# Altium project USB_to_RS485.PrjPcb
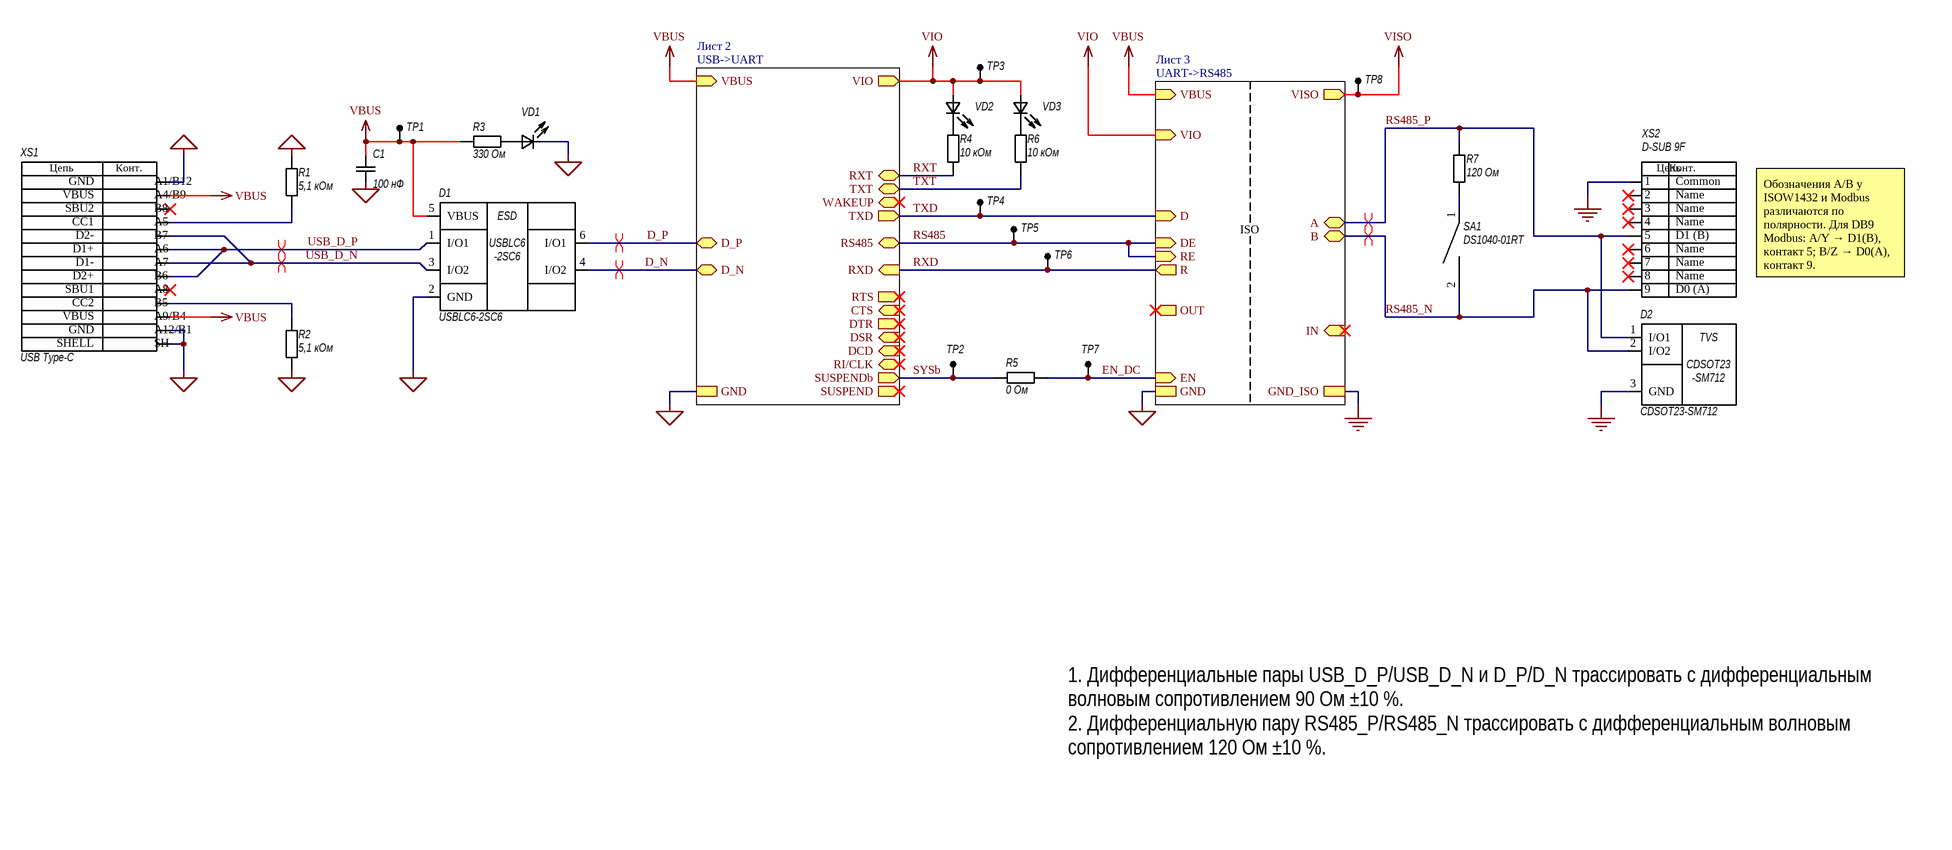
[diagram p0: MAIN.SchDoc]
п_Утв_Р: Лыткин; п_Разраб_Р: Иванов; п_Пров_Р: Смирнов; п_Н_контр_Р: Попов; Раздел: Документация; ПервПримен: XXXX.426477.001; Перв.Примен.: XXXX.426477.001; Обозначение_Код: XXXX.426477.001 Э3; Обозначение_PCB: XXXX.758765.001; Обозначение: XXXX.426477.001; Наименование_PCB: Плата печатная; Наименование1: Преобразователь USB–RS485; Наименование: Преобразователь USB–RS485; Код_документа_SCH: Э3; Вид_документа_SCH: Схема электрическая принципиальная; sheet_out_name: Преобразователь USB–RS485 XXXX.426477.001 Э3; GOSTBOM_AllowNoPCB: 0; draft_pcb_out: Плата печатная XXXX.758765.001; draft_ad_out: Преобразователь USB–RS485 XXXX.426477.001 СБ
3 sheets, 46 parts. Net scope: strictly hierarchical (ports join the sheet entries above them; power ports are local).
Board file: PCB.PcbDoc
Sheets:
  MAIN.SchDoc
    U_USBtoUART = USBtoUART.SchDoc
    U_USB_to_UART = UARTtoRS485.SchDoc

## Sheet MAIN.SchDoc
size 420 x 297 mm; SheetNumber: 1; SheetTotal: 3; SPICEModelCacheFXBRRBJG: <root> / <DocumentId>FXBRRBJG</DocumentId> / <CacheFrame Number="0"> / <Model Name="my_lib_c_rc" Kind="CKT"> / <Text>* MY_LIB YAGEO CC X7R: nominal capacitance, DFmax-derived Rs, minimum insulation. / * Source: YAGEO CC X7R March 6 2026 V.27 pp14-15,20. / * Rs=DFmax/(2*pi*1000*Cnom); Rins=min(1e10,K/Cnom). / * Constant Rs is justified at 1kHz only. Leakage adds a small extra AC loss. / * No tolerance, temperature, DC bias, ESL, aging, absorption or breakdown. / .SUBCKT MY_LIB_C_RC 1 2 PARAMS: Cvalue=1n Rsvalue=1 Rinsvalue=1e10 / Rloss 1 3 {Rsvalue} / Cmain 3 2 {Cvalue} / Rleak 1 2 {Rinsvalue} / .ENDS MY_LIB_C_RC</Text> / </Model> / </CacheFrame> / </root>

### Parts
C1  100 нФ  [CAPC2012X135N]
D1  USBLC6-2SC6  [ST_SOT23-6L]
D2  CDSOT23-SM712  [BOURNS_CDSOT23_SM712]
R1  5,1 кОм  [RESC2012X70N]
R2  5,1 кОм  [RESC2012X70N]
R3  330 Ом  [RESC2012X70N]
R4  10 кОм  [RESC2012X70N]
R5  0 Ом  [RESC2012X70N]
R6  10 кОм  [RESC2012X70N]
R7  120 Ом  [RESC2012X70N]
SA1  DS1040-01RT  [CONNFLY_DS1040_01RT]
TP1  D1.5mm  [TestPoint_Pad_D1.5mm]  (value not drawn)  (no BOM)
TP2  D1.5mm  [TestPoint_Pad_D1.5mm]  (value not drawn)  (no BOM)
TP3  D1.5mm  [TestPoint_Pad_D1.5mm]  (value not drawn)  (no BOM)
TP4  D1.5mm  [TestPoint_Pad_D1.5mm]  (value not drawn)  (no BOM)
TP5  D1.5mm  [TestPoint_Pad_D1.5mm]  (value not drawn)  (no BOM)
TP6  D1.5mm  [TestPoint_Pad_D1.5mm]  (value not drawn)  (no BOM)
TP7  D1.5mm  [TestPoint_Pad_D1.5mm]  (value not drawn)  (no BOM)
TP8  D1.5mm  [TestPoint_Pad_D1.5mm]  (value not drawn)  (no BOM)
VD1  TO-2013BC-PG  [LED_OA2013_080_090_1C2A]  (value not drawn)
VD2  TO-2013BC-PG  [LED_OA2013_080_090_1C2A]  (value not drawn)
VD3  TO-2013BC-PG  [LED_OA2013_080_090_1C2A]  (value not drawn)
XS1  USB Type-C  PinA1_B12_Name: GND  PinA4_B9_Name: VBUS  PinB8_Name: SBU2  PinA5_Name: CC1  PinB7_Name: D2-  PinA6_Name: D1+  PinA7_Name: D1-  PinB6_Name: D2+  PinA8_Name: SBU1  PinB5_Name: CC2  PinSH_Name: SHELL  [USB4110-GF-A_GCT]
XS2  D-SUB 9F  Pin9_Name: D0 (A)  Pin8_Name: Name  Pin5_Name: D1 (B)  Pin1_Name: Common  [CONNFLY_DS1037_01_09F]

### Sub-sheets
U_USB_to_UART = UARTtoRS485.SchDoc: VBUS (in), GND, OUT (out), EN (in), IN (in), VISO (out), GND_ISO, A (bidir), B (bidir), D (in), DE (in), RE (in), R (out), VIO (in)  | Page: Лист 3; Name: UART->RS485
U_USBtoUART = USBtoUART.SchDoc: RXT (bidir), TXT (bidir), WAKEUP (bidir), RS485 (bidir), TXD (out), RXD (in), VBUS (in), GND, VIO (out), SUSPENDb (out), SUSPEND (out), RTS (out), CTS (in), DTR (out), DSR (in), DCD (in), RI/CLK (bidir), D_N (bidir), D_P (bidir)  | Page: Лист 2; Name: USB->UART

### Nets
GND: C1.1 D1.2(GND) R1.2 R2.1 VD1.1(C) XS1.A1/B12(GND) XS1.A12/B1(GND) XS1.SH(SHELL) ; sheet U_USBtoUART/GND, sheet U_USB_to_UART/GND
GND_ISO: D2.3(GND) XS2.1(Name) ; sheet U_USB_to_UART/GND_ISO
VBUS: C1.2 D1.5(VBUS) R3.1 TP1.1(TP) XS1.A4/B9(VBUS) XS1.A9/B4(VBUS) ; sheet U_USBtoUART/VBUS, sheet U_USB_to_UART/VBUS
VIO: TP3.1(TP) VD2.2(A) VD3.2(A) ; sheet U_USBtoUART/VIO, sheet U_USB_to_UART/VIO
VISO: TP8.1(TP) ; sheet U_USB_to_UART/VISO
D_N: D1.4(I/O2) ; sheet U_USBtoUART/D_N
D_P: D1.6(I/O1) ; sheet U_USBtoUART/D_P
EN_DC: R5.2 TP7.1(TP) ; sheet U_USB_to_UART/EN
RS485: TP5.1(TP) ; sheet U_USBtoUART/RS485, sheet U_USB_to_UART/DE, sheet U_USB_to_UART/RE
RS485_N: D2.2(I/O2) SA1.2 XS2.9(Name) ; sheet U_USB_to_UART/B
RS485_P: D2.1(I/O1) R7.2 XS2.5(Name) ; sheet U_USB_to_UART/A
RXD: TP6.1(TP) ; sheet U_USBtoUART/RXD, sheet U_USB_to_UART/R
RXT: R4.1 ; sheet U_USBtoUART/RXT
SYSb: R5.1 TP2.1(TP) ; sheet U_USBtoUART/SUSPENDb
TXD: TP4.1(TP) ; sheet U_USBtoUART/TXD, sheet U_USB_to_UART/D
TXT: R6.1 ; sheet U_USBtoUART/TXT
USB_D_N: D1.3(I/O2) XS1.A7(D-1) XS1.B7(D-2)
USB_D_P: D1.1(I/O1) XS1.A6(D+1) XS1.B6(D+2)
NetR1_1: R1.1 XS1.A5(CC1)
NetR2_2: R2.2 XS1.B5(CC2)
NetR3_2: R3.2 VD1.2(A)
NetR4_2: R4.2 VD2.1(C)
NetR6_2: R6.2 VD3.1(C)
NetR7_1: R7.1 SA1.1

Not connected (* = marked no-connect by the designer): XS1 A8(SBU1)* B8(SBU2)*; XS2 2(Name)* 3(Name)* 4(Name)* 6(Name)* 7(Name)* 8(Name)*

### Layout directives
differential pair: D_N, D_P, RS485_N, RS485_P, USB_D_N, USB_D_P

### Notes on the sheet
- ISO
- Обозначения A/B у ISOW1432 и Modbus различаются по полярности. Для DB9 Modbus: A/Y → D1(B), контакт 5; B/Z → D0(A), контакт 9.
- 1. Дифференциальные пары USB_D_P/USB_D_N и D_P/D_N трассировать с дифференциальным волновым сопротивлением 90 Ом ±10 %.
  2. Дифференциальную пару RS485_P/RS485_N трассировать с дифференциальным волновым сопротивлением 120 Ом ±10 %.
- Перв. примен.
- Справ. №
- Подп. дата
- Инв. № дубл.
- Взам. инв. №
- Подп. и дата
- Изм.
- Разраб.
- Лист
- № докум.
- Подп.
- Дата
- Лит.
- Масса
- Масштаб
- Пров.
- Т.контр.
- Листов
- Инв. № подл.
- Н.контр.
- Утв.
- ALTIUM GOSTBOM2.0 KEV
- Копировал
- Формат А3
- (in symbol U0003) ESD; USBLC6; -2SC6
- (in symbol U0005) TVS; CDSOT23; -SM712
- (in symbol XS0001) Цепь; Конт.
- (in symbol XS0002) Конт.; Цепь

### Library data of the parts
C1 = C0132: Конденсатор 100 нФ ±20% 100 В X7R 0805; Manufacturer: YAGEO; MPN: CC0805MKX7R0BB104; ID: C0132; Value: 100n; Voltage: 100 В; Notes: YAGEO CC; список 20.10.2026; CapacitanceNominalF: 1E-7; DissipationFactorMax: 0.025; DFTestFrequencyHz: 1000; DFTestVoltageVrms: 1; DFTestTemperatureC: 20; InsulationTimeConstantMinS: 500; InsulationResistanceMinOhm: 5000000000; InsulationTestVoltageV: 100; InsulationTestDurationS: 60; EquivalentSeriesResistanceOhm: 39.7887357729738; Type: Конденсатор; ESKD_value: 100 нФ; Tolerance: ±20%; Package: 0805; CommentBase: Конденсатор 100 нФ ±20% 100 В X7R 0805; Dielectric: X7R; ComponentLink2URL: https://yageogroup.com/content/datasheet/asset/file/UPY-GPHC_X7R_6_3V-TO-250V; ComponentLink2Description: Даташит — производитель; HelpURL: C:\Users\Nomatin\Documents\Altium\MY_LIB\MY_LIB\Datasheets\YAGEO_CC_X7R.pdf; ComponentLink1URL: C:\Users\Nomatin\Documents\Altium\MY_LIB\MY_LIB\Datasheets\YAGEO_CC_X7R.pdf; ComponentLink1Description: Даташит — локальный; Datasheet: C:\Users\Nomatin\Documents\Altium\MY_LIB\MY_LIB\Datasheets\YAGEO_CC_X7R.pdf
D1 = U0003: Микросхема USBLC6-2SC6; Manufacturer: STMicroelectronics; ID: U0003; Voltage: 5.25 V (VRM); Notes: ESD-защита двух линий USB. Tj −40…+150 °C (не TA), табл. 1 absolute ratings. I/O1=1,6; I/O2=3,4; GND=2; VBUS=5.; TemperatureReference: Tj (junction), °C; Table 1 absolute ratings; JunctionTemperatureMin: -40; JunctionTemperatureMax: 150; Type: Микросхема; Value: USBLC6-2SC6; ESKD_value: USBLC6-2SC6; Package: SOT23-6L; MPN: USBLC6-2SC6; CommentBase: Микросхема USBLC6-2SC6; OperatingTemperatureMin: -40; OperatingTemperatureMax: 150; StorageTemperatureMin: -55; StorageTemperatureMax: 150; Datasheet: C:\Users\Nomatin\Documents\Altium\MY_LIB\MY_LIB\Datasheets\USBLC6-2_ST.pdf; DatasheetRevision: DS4260 Rev 7, December 2021; ComponentLink1Description: Даташит — локальный; ComponentLink1URL: C:\Users\Nomatin\Documents\Altium\MY_LIB\MY_LIB\Datasheets\USBLC6-2_ST.pdf; ComponentLink2URL: https://www.st.com/resource/en/datasheet/usblc6-2.pdf; ComponentLink2Description: Даташит — производитель; HelpURL: C:\Users\Nomatin\Documents\Altium\MY_LIB\MY_LIB\Datasheets\USBLC6-2_ST.pdf
D2 = U0005: TVS-сборка CDSOT23-SM712; Manufacturer: Bourns; ID: U0005; Power: 400 Вт (импульс 8/20 мкс); Voltage: VWM: 7/12 В (по полярности); Notes: RS-485 TVS: 1=I/O1, 2=I/O2, 3=GND. VWM: 3→1/2 — 7 В; 1/2→3 — 12 В. IPP 17 А, 8/20 мкс.; TemperatureReference: TOPR, °C; datasheet absolute ratings; Type: TVS-сборка; Value: CDSOT23-SM712; ESKD_value: CDSOT23-SM712; Package: SOT23-3; MPN: CDSOT23-SM712; CommentBase: TVS-сборка CDSOT23-SM712; OperatingTemperatureMin: -55; OperatingTemperatureMax: 150; StorageTemperatureMin: -55; StorageTemperatureMax: 150; Datasheet: C:\Users\Nomatin\Documents\Altium\MY_LIB\MY_LIB\Datasheets\CDSOT23-SM712_Bourns.pdf; DatasheetRevision: Rev. 06/24; ComponentLink1Description: Даташит — локальный; ComponentLink1URL: C:\Users\Nomatin\Documents\Altium\MY_LIB\MY_LIB\Datasheets\CDSOT23-SM712_Bourns.pdf; ComponentLink2Description: Даташит — производитель; ComponentLink2URL: https://www.bourns.com/docs/product-datasheets/cdsot23-sm712.pdf; HelpURL: C:\Users\Nomatin\Documents\Altium\MY_LIB\MY_LIB\Datasheets\CDSOT23-SM712_Bourns.pdf
R1 R2 = R0243: Резистор 5,1 кОм ±5% 0805; Manufacturer: YAGEO; MPN: RC0805JR-075K1L; ID: R0243; Value: 5.1k; Power: 0,125 Вт; Voltage: 150 В макс.; Notes: RC_L; E24; P при 70 °C; SPICE: +100 ppm/°C при 25 °C — положительная граница ±100, не измеренный ТКС (RC_L, табл.2/5, стр.5/8).; TCR: ±100 ppm/°C; Type: Резистор; ESKD_value: 5,1 кОм; Tolerance: ±5%; Package: 0805; CommentBase: Резистор 5,1 кОм ±5% 0805; ComponentLink2URL: https://yageogroup.com/content/datasheet/asset/file/PYU-RC_GROUP_51_ROHS_L; ComponentLink2Description: Даташит — производитель; HelpURL: C:\Users\Nomatin\Documents\Altium\MY_LIB\MY_LIB\Datasheets\YAGEO_RC_L.pdf; ComponentLink1URL: C:\Users\Nomatin\Documents\Altium\MY_LIB\MY_LIB\Datasheets\YAGEO_RC_L.pdf; ComponentLink1Description: Даташит — локальный; Datasheet: C:\Users\Nomatin\Documents\Altium\MY_LIB\MY_LIB\Datasheets\YAGEO_RC_L.pdf
R3 = R0214: Резистор 330 Ом ±5% 0805; Manufacturer: YAGEO; MPN: RC0805JR-07330RL; ID: R0214; Value: 330R; Power: 0,125 Вт; Voltage: 150 В макс.; Notes: RC_L; E24; P при 70 °C; SPICE: +100 ppm/°C при 25 °C — положительная граница ±100, не измеренный ТКС (RC_L, табл.2/5, стр.5/8).; TCR: ±100 ppm/°C; Type: Резистор; ESKD_value: 330 Ом; Tolerance: ±5%; Package: 0805; CommentBase: Резистор 330 Ом ±5% 0805; Datasheet: C:\Users\Nomatin\Documents\Altium\MY_LIB\MY_LIB\Datasheets\YAGEO_RC_L.pdf; ComponentLink1Description: Даташит — локальный; ComponentLink1URL: C:\Users\Nomatin\Documents\Altium\MY_LIB\MY_LIB\Datasheets\YAGEO_RC_L.pdf; ComponentLink2Description: Даташит — производитель; ComponentLink2URL: https://yageogroup.com/content/datasheet/asset/file/PYU-RC_GROUP_51_ROHS_L; HelpURL: C:\Users\Nomatin\Documents\Altium\MY_LIB\MY_LIB\Datasheets\YAGEO_RC_L.pdf
R4 R6 = R0250: Резистор 10 кОм ±5% 0805; Manufacturer: YAGEO; MPN: RC0805JR-0710KL; ID: R0250; Value: 10k; Power: 0,125 Вт; Voltage: 150 В макс.; Notes: RC_L; E24; P при 70 °C; SPICE: +100 ppm/°C при 25 °C — положительная граница ±100, не измеренный ТКС (RC_L, табл.2/5, стр.5/8).; TCR: ±100 ppm/°C; Type: Резистор; ESKD_value: 10 кОм; Tolerance: ±5%; Package: 0805; CommentBase: Резистор 10 кОм ±5% 0805; ComponentLink2URL: https://yageogroup.com/content/datasheet/asset/file/PYU-RC_GROUP_51_ROHS_L; ComponentLink2Description: Даташит — производитель; HelpURL: C:\Users\Nomatin\Documents\Altium\MY_LIB\MY_LIB\Datasheets\YAGEO_RC_L.pdf; ComponentLink1URL: C:\Users\Nomatin\Documents\Altium\MY_LIB\MY_LIB\Datasheets\YAGEO_RC_L.pdf; ComponentLink1Description: Даташит — локальный; Datasheet: C:\Users\Nomatin\Documents\Altium\MY_LIB\MY_LIB\Datasheets\YAGEO_RC_L.pdf
R5 = R0005: Резистор 0 Ом 0805; Manufacturer: YAGEO; MPN: RC0805JR-070RL; ID: R0005; Value: 0R; Power: 0,125 Вт; Notes: Перемычка RC_L; R < 50 мОм; номинальный ток 2 А; J — код заказа перемычки, процентный допуск не применяется. Источник: https://www.yageogroup.com/content/datasheet/asset/file/PYU-RC_GROUP_51_ROHS_L; SPICE: ТКС перемычек не указан в RC_L; R=0,05 Ом сохранено, температурная зависимость не моделируется.; TCR: Не указан; Type: Резистор; ESKD_value: 0 Ом; Package: 0805; CommentBase: Резистор 0 Ом 0805; ComponentLink2URL: https://yageogroup.com/content/datasheet/asset/file/PYU-RC_GROUP_51_ROHS_L; ComponentLink2Description: Даташит — производитель; HelpURL: C:\Users\Nomatin\Documents\Altium\MY_LIB\MY_LIB\Datasheets\YAGEO_RC_L.pdf; ComponentLink1URL: C:\Users\Nomatin\Documents\Altium\MY_LIB\MY_LIB\Datasheets\YAGEO_RC_L.pdf; ComponentLink1Description: Даташит — локальный; Datasheet: C:\Users\Nomatin\Documents\Altium\MY_LIB\MY_LIB\Datasheets\YAGEO_RC_L.pdf
R7 = R0204: Резистор 120 Ом ±5% 0805; Manufacturer: YAGEO; MPN: RC0805JR-07120RL; ID: R0204; Value: 120R; Power: 0,125 Вт; Voltage: 150 В макс.; Notes: RC_L; E24; P при 70 °C; SPICE: +100 ppm/°C при 25 °C — положительная граница ±100, не измеренный ТКС (RC_L, табл.2/5, стр.5/8).; TCR: ±100 ppm/°C; Type: Резистор; ESKD_value: 120 Ом; Tolerance: ±5%; Package: 0805; CommentBase: Резистор 120 Ом ±5% 0805; ComponentLink2URL: https://yageogroup.com/content/datasheet/asset/file/PYU-RC_GROUP_51_ROHS_L; ComponentLink2Description: Даташит — производитель; HelpURL: C:\Users\Nomatin\Documents\Altium\MY_LIB\MY_LIB\Datasheets\YAGEO_RC_L.pdf; ComponentLink1URL: C:\Users\Nomatin\Documents\Altium\MY_LIB\MY_LIB\Datasheets\YAGEO_RC_L.pdf; ComponentLink1Description: Даташит — локальный; Datasheet: C:\Users\Nomatin\Documents\Altium\MY_LIB\MY_LIB\Datasheets\YAGEO_RC_L.pdf
SA1 = SA0001: Переключатель DS1040-01RT; Manufacturer: CONNFLY; ID: SA0001; Voltage: 24 В AC/DC; Notes: 1 позиция SPST Piano; красный корпус. 3D-модель приблизительная: см. REVIEW.md в папке footprint.; CurrentRating: 100 мА; TemperatureReference: Temperature Range, °C; DS1040 sheet 3; ContactForm: SPST; Positions: 1; MPN: DS1040-01RT; Datasheet: C:\Users\Nomatin\Documents\Altium\MY_LIB\MY_LIB\Datasheets\CONNFLY_DS1040_series.pdf; Type: Переключатель; Value: DS1040-01RT; ESKD_value: DS1040-01RT; Package: Piano DIP, THT, 2 вывода; CommentBase: Переключатель DS1040-01RT; DatasheetRevision: C-DS1040-01XT-E, Rev. E, 05.07.2019; ComponentLink1Description: Даташит — локальный; ComponentLink1URL: C:\Users\Nomatin\Documents\Altium\MY_LIB\MY_LIB\Datasheets\CONNFLY_DS1040_series.pdf; OperatingTemperatureMin: -40; OperatingTemperatureMax: 105; ComponentLink2URL: https://www.connfly.com/static/upload/file/pdf/DS1040.pdf; ComponentLink2Description: Даташит — производитель; HelpURL: C:\Users\Nomatin\Documents\Altium\MY_LIB\MY_LIB\Datasheets\CONNFLY_DS1040_series.pdf
TP1-TP8 = TP0002: Контрольная точка Площадка Ø1,5 мм; ID: TP0002; Notes: Одна круглая площадка Top Layer; маска открыта +0,05 мм; без отверстия, пасты и шелкографии. Standard (No BOM).; DiameterMm: 1.5; Standard: GOST 2.721-74, Table 6a, item 7; Type: Контрольная точка; Value: D1.5mm; ESKD_value: D1.5mm; Package: Площадка Ø1,5 мм; CommentBase: Контрольная точка Площадка Ø1,5 мм; ComponentType: Standard (No BOM)
VD1-VD3 = HL0009: Светодиод Чистый зелёный 3,2В 705мкд 0805; Manufacturer: Oasistek; ID: HL0009; Voltage: 3,2 В (тип., IF=20 мА); Notes: VF/IV: каталог 2021, IF=20 мА. Площадки по даташиту: 0,80×1,20; зазор 0,90 мм. 1=K, 2=A. Типовая 3D, не точный CAD Oasistek.; WavelengthNm: 525; ForwardVoltageTypicalV: 3.2; ForwardVoltageMaxV: 3.6; TestCurrentMa: 20; ViewingAngleDeg: 120; IntensityMinMcd: 321; IntensityTypicalMcd: 705; PinMapping: 1=C (K), 2=A; ChipMaterial: InGaN; LED_IS: 8.21368101376E-51; LED_N: 1; LED_RS: 13.4860774673; Type: Светодиод; Value: TO-2013BC-PG; ESKD_value: TO-2013BC-PG; Package: 0805; MPN: TO-2013BC-PG; CommentBase: Светодиод Чистый зелёный 3,2В 705мкд 0805; Datasheet: C:\Users\Nomatin\Documents\Altium\MY_LIB\MY_LIB\Datasheets\Oasistek_LED\TO-2013BC-PG.pdf; DatasheetRevision: Параметры: каталог 2021, стр.19–20; пины: Rev. A-1; 2017-06-09; GS1706012; ComponentLink1Description: Даташит — локальный; ComponentLink1URL: C:\Users\Nomatin\Documents\Altium\MY_LIB\MY_LIB\Datasheets\Oasistek_LED\TO-2013BC-PG.pdf; Color: Чистый зелёный; Family: TO-2013BC; ComponentLink2Description: Даташит — производитель; ComponentLink2URL: https://www.oasistek.com/upload/2021_SMD_Lamp_Catalogue.pdf; HelpURL: C:\Users\Nomatin\Documents\Altium\MY_LIB\MY_LIB\Datasheets\Oasistek_LED\TO-2013BC-PG.pdf
XS1 = XS0001: Разъём USB Type-C USB4110-GF-A; Manufacturer: GCT; ID: XS0001; Notes: USB 2.0; 12 сигнальных выводов + SH; 4 площадки корпуса SH; Value: USB Type-C; MPN: USB4110-GF-A; Datasheet: C:\Users\Nomatin\Documents\Altium\MY_LIB\MY_LIB\Datasheets\GCT_USB4110\USB4110_drawing.pdf; PinA9_B4_Name: VBUS; PinA12_B1_Name: GND; Type: Разъём; ESKD_value: USB Type-C; Package: USB Type-C, SMT; CommentBase: Разъём USB Type-C USB4110-GF-A; DatasheetRevision: B4, 22.05.2024; ComponentLink1Description: Даташит — локальный; ComponentLink1URL: C:\Users\Nomatin\Documents\Altium\MY_LIB\MY_LIB\Datasheets\GCT_USB4110\USB4110_drawing.pdf; ComponentLink2URL: https://gct.co/files/drawings/usb4110.pdf; ComponentLink2Description: Даташит — производитель; HelpURL: C:\Users\Nomatin\Documents\Altium\MY_LIB\MY_LIB\Datasheets\GCT_USB4110\USB4110_drawing.pdf
XS2 = XS0002: Разъём D-SUB 9F DS1037-01-09F; Manufacturer: CONNFLY; ID: XS0002; Notes: Контакты 1–9. Два крепления NPTH без электрического подключения. STEP пользователя встроен. См. REVIEW.md.; Value: D-SUB 9F; Pin7_Name: Name; Pin6_Name: Name; Pin4_Name: Name; Pin3_Name: Name; Pin2_Name: Name; Type: Разъём; ESKD_value: D-SUB 9F; Package: D-SUB-9, угловая розетка, THT; MPN: DS1037-01-09F; CommentBase: Разъём D-SUB 9F DS1037-01-09F; Datasheet: C:\Users\Nomatin\Documents\Altium\MY_LIB\MY_LIB\Datasheets\CONNFLY_DS1037-01.pdf; DatasheetRevision: C, 08.08.2017; ComponentLink1Description: Даташит — локальный; ComponentLink1URL: C:\Users\Nomatin\Documents\Altium\MY_LIB\MY_LIB\Datasheets\CONNFLY_DS1037-01.pdf; ComponentLink2URL: https://www.connfly.com/static/upload/file/pdf/DS1037-01.pdf; ComponentLink2Description: Даташит — производитель; HelpURL: C:\Users\Nomatin\Documents\Altium\MY_LIB\MY_LIB\Datasheets\CONNFLY_DS1037-01.pdf

## Sheet USBtoUART.SchDoc
size 209 x 297 mm; SheetNumber: 2; SheetTotal: 3
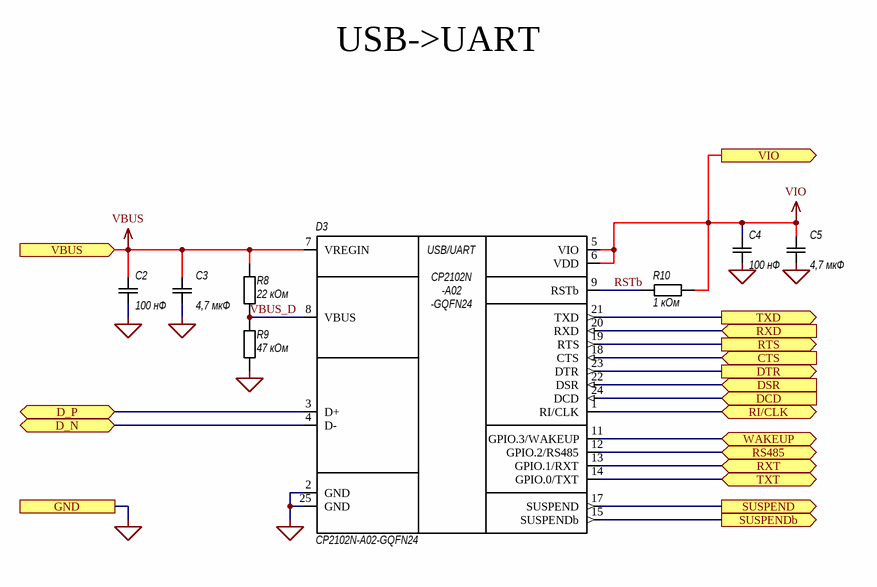
[diagram p1: USBtoUART.SchDoc]

### Parts
C2  100 нФ  [CAPC2012X135N]
C3  4,7 мкФ  [CAPC2012X135N]
C4  100 нФ  [CAPC2012X135N]
C5  4,7 мкФ  [CAPC2012X135N]
D3  CP2102N-A02-GQFN24  [CP2102N-A02-GQFN24_DS15]
R8  22 кОм  [RESC2012X70N]
R9  47 кОм  [RESC2012X70N]
R10  1 кОм  [RESC2012X70N]

### Ports
CTS (in, see MAIN[2A]), D_N (bidir, see MAIN[1A]), D_P (bidir, see MAIN[1A]), DCD (in, see MAIN[2A]), DSR (in, see MAIN[2A]), DTR (out, see MAIN[2A]), GND (see MAIN[1A], UARTtoRS485[1A]), RI/CLK (bidir, see MAIN[2A]), RS485 (bidir, see MAIN[2A]), RTS (out, see MAIN[2A]), RXD (in, see MAIN[2A]), RXT (bidir, see MAIN[2A]), SUSPEND (out, see MAIN[2A]), SUSPENDb (out, see MAIN[2A]), TXD (out, see MAIN[2A]), TXT (bidir, see MAIN[2A]), VBUS (in, see MAIN[1A], UARTtoRS485[1A]), VIO (out, see MAIN[2A], UARTtoRS485[1A]), WAKEUP (bidir, see MAIN[2A])

### Nets
GND: C2.1 C3.1 C4.1 C5.1 D3.2(GND) D3.25(GND) R9.1 ; port GND
VBUS: C2.2 C3.2 D3.7(VREGIN) R8.2 ; port VBUS
VIO: C4.2 C5.2 D3.5(VIO) D3.6(VDD) R10.2 ; port VIO
D_N: D3.4(D-) ; port D_N
D_P: D3.3(D+) ; port D_P
RS485: D3.12(GPIO.2/RS485) ; port RS485
RSTb: D3.9(RSTb) R10.1
RXD: D3.20(RXD) ; port RXD
RXT: D3.13(GPIO.1/RXT) ; port RXT
SYSb: D3.15(SUSPENDb) ; port SUSPENDb
TXD: D3.21(TXD) ; port TXD
TXT: D3.14(GPIO.0/TXT) ; port TXT
VBUS_D: D3.8(VBUS) R8.1 R9.2
NetD3_1: D3.1(RI/CLK) ; port RI/CLK
NetD3_11: D3.11(GPIO.3/WAKEUP) ; port WAKEUP
NetD3_17: D3.17(SUSPEND) ; port SUSPEND
NetD3_18: D3.18(CTS) ; port CTS
NetD3_19: D3.19(RTS) ; port RTS
NetD3_22: D3.22(DSR) ; port DSR
NetD3_23: D3.23(DTR) ; port DTR
NetD3_24: D3.24(DCD) ; port DCD

Not connected (* = marked no-connect by the designer): D3 10(NC) 16(NC)

### Notes on the sheet
- USB->UART
- Подп. дата
- Инв. № дубл.
- Взам. инв. №
- Подп. и дата
- Инв. № подл.
- Изм.
- Лист
- № докум.
- Подп.
- Дата
- ALTIUM GOSTBOM2.0 KEV
- Копировал
- Формат А4
- (in symbol U0002) USB/UART; CP2102N; -A02; -GQFN24

### Library data of the parts
C2 C4 = C0132: as C1 on sheet MAIN; Type: Конденсатор; ESKD_value: 100 нФ; Tolerance: ±20%; Package: 0805; CommentBase: Конденсатор 100 нФ ±20% 100 В X7R 0805; Dielectric: X7R; ComponentLink2URL: https://yageogroup.com/content/datasheet/asset/file/UPY-GPHC_X7R_6_3V-TO-250V; ComponentLink2Description: Даташит — производитель; HelpURL: C:\Users\Nomatin\Documents\Altium\MY_LIB\MY_LIB\Datasheets\YAGEO_CC_X7R.pdf; ComponentLink1URL: C:\Users\Nomatin\Documents\Altium\MY_LIB\MY_LIB\Datasheets\YAGEO_CC_X7R.pdf; ComponentLink1Description: Даташит — локальный; Datasheet: C:\Users\Nomatin\Documents\Altium\MY_LIB\MY_LIB\Datasheets\YAGEO_CC_X7R.pdf
C3 C5 = C0140: Конденсатор 4,7 мкФ ±20% 25 В X7R 0805; Manufacturer: YAGEO; MPN: CC0805MKX7R8BB475; ID: C0140; Value: 4.7u; Voltage: 25 В; Notes: YAGEO CC; список 20.10.2026; CapacitanceNominalF: 4.7E-6; DissipationFactorMax: 0.1; DFTestFrequencyHz: 1000; DFTestVoltageVrms: 1; DFTestTemperatureC: 20; InsulationTimeConstantMinS: 100; InsulationResistanceMinOhm: 21276595.7446809; InsulationTestVoltageV: 25; InsulationTestDurationS: 60; EquivalentSeriesResistanceOhm: 3.38627538493394; Type: Конденсатор; ESKD_value: 4,7 мкФ; Tolerance: ±20%; Package: 0805; CommentBase: Конденсатор 4,7 мкФ ±20% 25 В X7R 0805; Dielectric: X7R; ComponentLink2URL: https://yageogroup.com/content/datasheet/asset/file/UPY-GPHC_X7R_6_3V-TO-250V; ComponentLink2Description: Даташит — производитель; HelpURL: C:\Users\Nomatin\Documents\Altium\MY_LIB\MY_LIB\Datasheets\YAGEO_CC_X7R.pdf; ComponentLink1URL: C:\Users\Nomatin\Documents\Altium\MY_LIB\MY_LIB\Datasheets\YAGEO_CC_X7R.pdf; ComponentLink1Description: Даташит — локальный; Datasheet: C:\Users\Nomatin\Documents\Altium\MY_LIB\MY_LIB\Datasheets\YAGEO_CC_X7R.pdf
D3 = U0002: Микросхема CP2102N-A02-GQFN24; Manufacturer: Silicon Labs; ID: U0002; Voltage: 3.0–3.6 V (VDD); 3.0–5.25 V (VREGIN); Notes: USB–UART, до 3 Мбод. EP=25 (GND). TA −40…+85 °C: табл. 3.1. Tj −40…+105 °C и хранение: absolute maximum, табл. 3.10.; TemperatureReference: TA (ambient), °C; recommended operating; JunctionTemperatureMin: -40; JunctionTemperatureMax: 105; Type: Микросхема; Value: CP2102N-A02-GQFN24; ESKD_value: CP2102N-A02-GQFN24; Package: QFN-24 4×4 mm, EP; MPN: CP2102N-A02-GQFN24; CommentBase: Микросхема CP2102N-A02-GQFN24; OperatingTemperatureMin: -40; OperatingTemperatureMax: 85; StorageTemperatureMin: -65; StorageTemperatureMax: 150; Datasheet: C:\Users\Nomatin\Documents\Altium\MY_LIB\MY_LIB\Datasheets\cp2102n-datasheet.pdf; DatasheetRevision: Rev. 1.5; ComponentLink1Description: Даташит — локальный; ComponentLink1URL: C:\Users\Nomatin\Documents\Altium\MY_LIB\MY_LIB\Datasheets\cp2102n-datasheet.pdf; ComponentLink2Description: Даташит — производитель; ComponentLink2URL: https://www.silabs.com/documents/public/data-sheets/cp2102n-datasheet.pdf; HelpURL: C:\Users\Nomatin\Documents\Altium\MY_LIB\MY_LIB\Datasheets\cp2102n-datasheet.pdf
R8 = R0258: Резистор 22 кОм ±5% 0805; Manufacturer: YAGEO; MPN: RC0805JR-0722KL; ID: R0258; Value: 22k; Power: 0,125 Вт; Voltage: 150 В макс.; Notes: RC_L; E24; P при 70 °C; SPICE: +100 ppm/°C при 25 °C — положительная граница ±100, не измеренный ТКС (RC_L, табл.2/5, стр.5/8).; TCR: ±100 ppm/°C; Type: Резистор; ESKD_value: 22 кОм; Tolerance: ±5%; Package: 0805; CommentBase: Резистор 22 кОм ±5% 0805; ComponentLink2URL: https://yageogroup.com/content/datasheet/asset/file/PYU-RC_GROUP_51_ROHS_L; ComponentLink2Description: Даташит — производитель; HelpURL: C:\Users\Nomatin\Documents\Altium\MY_LIB\MY_LIB\Datasheets\YAGEO_RC_L.pdf; ComponentLink1URL: C:\Users\Nomatin\Documents\Altium\MY_LIB\MY_LIB\Datasheets\YAGEO_RC_L.pdf; ComponentLink1Description: Даташит — локальный; Datasheet: C:\Users\Nomatin\Documents\Altium\MY_LIB\MY_LIB\Datasheets\YAGEO_RC_L.pdf
R9 = R0266: Резистор 47 кОм ±5% 0805; Manufacturer: YAGEO; MPN: RC0805JR-0747KL; ID: R0266; Value: 47k; Power: 0,125 Вт; Voltage: 150 В макс.; Notes: RC_L; E24; P при 70 °C; SPICE: +100 ppm/°C при 25 °C — положительная граница ±100, не измеренный ТКС (RC_L, табл.2/5, стр.5/8).; TCR: ±100 ppm/°C; Type: Резистор; ESKD_value: 47 кОм; Tolerance: ±5%; Package: 0805; CommentBase: Резистор 47 кОм ±5% 0805; ComponentLink2URL: https://yageogroup.com/content/datasheet/asset/file/PYU-RC_GROUP_51_ROHS_L; ComponentLink2Description: Даташит — производитель; HelpURL: C:\Users\Nomatin\Documents\Altium\MY_LIB\MY_LIB\Datasheets\YAGEO_RC_L.pdf; ComponentLink1URL: C:\Users\Nomatin\Documents\Altium\MY_LIB\MY_LIB\Datasheets\YAGEO_RC_L.pdf; ComponentLink1Description: Даташит — локальный; Datasheet: C:\Users\Nomatin\Documents\Altium\MY_LIB\MY_LIB\Datasheets\YAGEO_RC_L.pdf
R10 = R0226: Резистор 1 кОм ±5% 0805; Manufacturer: YAGEO; MPN: RC0805JR-071KL; ID: R0226; Value: 1k; Power: 0,125 Вт; Voltage: 150 В макс.; Notes: RC_L; E24; P при 70 °C; SPICE: +100 ppm/°C при 25 °C — положительная граница ±100, не измеренный ТКС (RC_L, табл.2/5, стр.5/8).; TCR: ±100 ppm/°C; Type: Резистор; ESKD_value: 1 кОм; Tolerance: ±5%; Package: 0805; CommentBase: Резистор 1 кОм ±5% 0805; ComponentLink2URL: https://yageogroup.com/content/datasheet/asset/file/PYU-RC_GROUP_51_ROHS_L; ComponentLink2Description: Даташит — производитель; HelpURL: C:\Users\Nomatin\Documents\Altium\MY_LIB\MY_LIB\Datasheets\YAGEO_RC_L.pdf; ComponentLink1URL: C:\Users\Nomatin\Documents\Altium\MY_LIB\MY_LIB\Datasheets\YAGEO_RC_L.pdf; ComponentLink1Description: Даташит — локальный; Datasheet: C:\Users\Nomatin\Documents\Altium\MY_LIB\MY_LIB\Datasheets\YAGEO_RC_L.pdf

## Sheet UARTtoRS485.SchDoc
size 209 x 297 mm; SheetNumber: 3; SheetTotal: 3; SPICEModelCacheQAQBARVM: <root> / <DocumentId>QAQBARVM</DocumentId> / <CacheFrame Number="0"> / <Model Name="my_lib_r_tcr" Kind="CKT"> / <Text>* MY_LIB first-order resistor temperature model. / * Component data source ONLY: YAGEO RC_L, Nov. 14 2025 V.14. / * Table 2, page 5: RC0603 0.1W / RC0805 0.125W, 1 and 5 percent: / * 1 &lt;= R &lt;= 10 ohms: +/-200 ppm/C; 10 ohms &lt; R &lt;= 1 megohm: +/-100 ppm/C. / * The user selected the POSITIVE specification limit for simulation. / * This is a linear corner estimate, NOT a measured or typical TCR. / * Table 5, page 8: reference +25 C, TCR tested at -55 C and +125 C. / * R(T) = Rvalue * (1 + TC1value * (T - 25 C)). TC1value is per degree C. / * Rated operating range is -55..155 C; above +125 C this linear model / * extrapolates the TCR test interval, not a guaranteed measured curve. / * No self-heating, initial tolerance, aging or power limiting is modeled. / * Jumper TCR is not specified; 0R components keep their separate model. / .SUBCKT MY_LIB_R_TCR 1 2 PARAMS: Rvalue=1 TC1value=0 / Rthermal 1 2 RTCR {Rvalue} / .MODEL RTCR R (TC1={TC1value} TNOM=25) / .ENDS MY_LIB_R_TCR</Text> / </Model> / </CacheFrame> / </root>
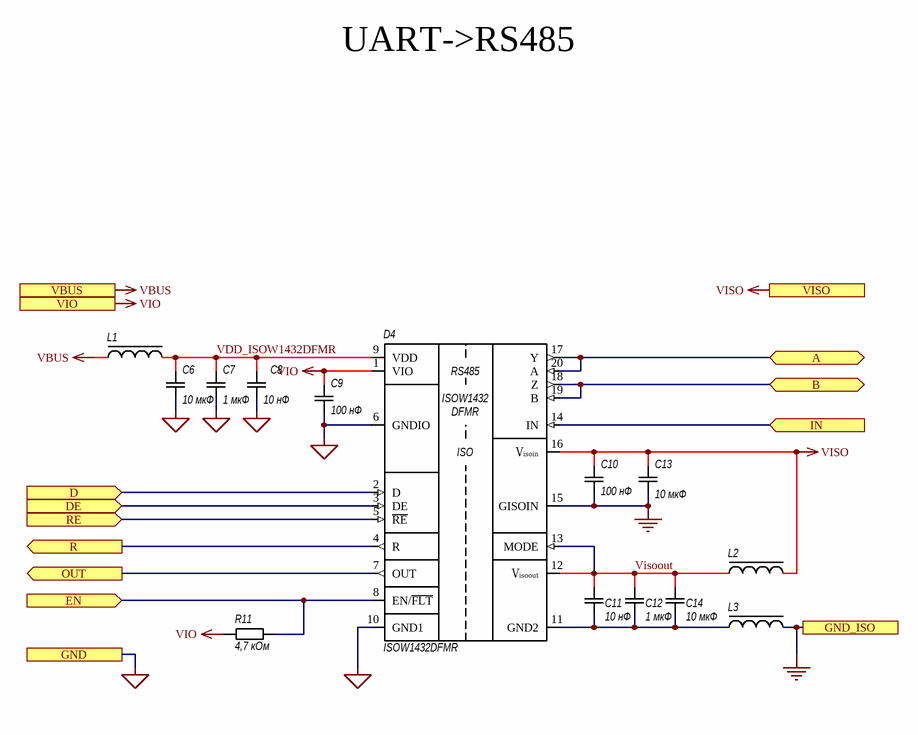
[diagram p2: UARTtoRS485.SchDoc]

### Parts
C6  10 мкФ  [CAPC2012X135N]
C7  1 мкФ  [CAPC2012X135N]
C8  10 нФ  [CAPC1608X90N]
C9  100 нФ  [CAPC2012X135N]
C10  100 нФ  [CAPC2012X135N]
C11  10 нФ  [CAPC1608X90N]
C12  1 мкФ  [CAPC2012X135N]
C13  10 мкФ  [CAPC2012X135N]
C14  10 мкФ  [CAPC2012X135N]
D4  ISOW1432DFMR  [TI_DFM0020A]
L1  600 Ом @ 100 МГц  [TDK_MPZ2012S_2012]  (value not drawn)
L2  330 Ом @ 100 МГц  [Murata_BLM21PG_2012_Reflow]  (value not drawn)
L3  330 Ом @ 100 МГц  [Murata_BLM21PG_2012_Reflow]  (value not drawn)
R11  4,7 кОм  [RESC2012X70N]

### Ports
A (bidir, see MAIN[2A]), B (bidir, see MAIN[2A]), D (in, see MAIN[2A]), DE (in, see MAIN[2A]), EN (in, see MAIN[2A]), GND (see MAIN[2A], USBtoUART[1A]), GND_ISO (see MAIN[2A]), IN (in, see MAIN[2A]), OUT (out, see MAIN[2A]), R (out, see MAIN[2A]), RE (in, see MAIN[2A]), VBUS (in, see MAIN[2A], USBtoUART[1A]), VIO (in, see MAIN[2A], USBtoUART[1A]), VISO (out, see MAIN[2A])

### Nets
GND: C6.1 C7.1 C8.1 C9.1 D4.6(GNDIO) D4.10(GND1) ; port GND
GND_ISO: C10.1 C13.1 D4.15(GISOIN) L3.1 ; port GND_ISO
VBUS: L1.2 ; port VBUS
VIO: C9.2 D4.1(VIO) R11.2 ; port VIO
VISO: C10.2 C13.2 D4.16(Vᵢₛₒᵢₙ) L2.1 ; port VISO
EN_DC: D4.8(EN/~{FLT}) R11.1 ; port EN
RS485: D4.3(DE) D4.5(~{RE}) ; port DE, port RE
RS485_N: D4.18(Z) D4.19(B) ; port B
RS485_P: D4.17(Y) D4.20(A) ; port A
RXD: D4.4(R) ; port R
TXD: D4.2(D) ; port D
VDD_ISOW1432DFMR: C6.2 C7.2 C8.2 D4.9(VDD) L1.1
Visoout: C11.2 C12.2 C14.2 D4.12(Vᵢₛₒₒᵤₜ) D4.13(MODE) L2.2
NetC11_1: C11.1 C12.1 C14.1 D4.11(GND2) L3.2
NetD4_7: D4.7(OUT) ; port OUT
NetD4_14: D4.14(IN) ; port IN

### Notes on the sheet
- UART->RS485
- Подп. дата
- Инв. № дубл.
- Взам. инв. №
- Подп. и дата
- Инв. № подл.
- Изм.
- Лист
- № докум.
- Подп.
- Дата
- ALTIUM GOSTBOM2.0 KEV
- Копировал
- Формат А4
- (in symbol U0004) RS485; ISOW1432; DFMR; ISO

### Library data of the parts
C6 C13 C14 = C0141: Конденсатор 10 мкФ ±20% 16 В X7R 0805; Manufacturer: YAGEO; MPN: CC0805MKX7R7BB106; ID: C0141; Value: 10u; Voltage: 16 В; Notes: YAGEO CC; список 20.10.2026; CapacitanceNominalF: 1E-5; DissipationFactorMax: 0.1; DFTestFrequencyHz: 1000; DFTestVoltageVrms: 1; DFTestTemperatureC: 20; InsulationTimeConstantMinS: 100; InsulationResistanceMinOhm: 10000000; InsulationTestVoltageV: 16; InsulationTestDurationS: 60; EquivalentSeriesResistanceOhm: 1.59154943091895; Type: Конденсатор; ESKD_value: 10 мкФ; Tolerance: ±20%; Package: 0805; CommentBase: Конденсатор 10 мкФ ±20% 16 В X7R 0805; Dielectric: X7R; ComponentLink2URL: https://yageogroup.com/content/datasheet/asset/file/UPY-GPHC_X7R_6_3V-TO-250V; ComponentLink2Description: Даташит — производитель; HelpURL: C:\Users\Nomatin\Documents\Altium\MY_LIB\MY_LIB\Datasheets\YAGEO_CC_X7R.pdf; ComponentLink1URL: C:\Users\Nomatin\Documents\Altium\MY_LIB\MY_LIB\Datasheets\YAGEO_CC_X7R.pdf; ComponentLink1Description: Даташит — локальный; Datasheet: C:\Users\Nomatin\Documents\Altium\MY_LIB\MY_LIB\Datasheets\YAGEO_CC_X7R.pdf
C7 C12 = C0138: Конденсатор 1 мкФ ±20% 100 В X7R 0805; Manufacturer: YAGEO; MPN: CC0805MKX7R0BB105; ID: C0138; Value: 1u; Voltage: 100 В; Notes: YAGEO CC; список 20.10.2026; CapacitanceNominalF: 1E-6; DissipationFactorMax: 0.05; DFTestFrequencyHz: 1000; DFTestVoltageVrms: 1; DFTestTemperatureC: 20; InsulationTimeConstantMinS: 500; InsulationResistanceMinOhm: 500000000; InsulationTestVoltageV: 100; InsulationTestDurationS: 60; EquivalentSeriesResistanceOhm: 7.95774715459477; Type: Конденсатор; ESKD_value: 1 мкФ; Tolerance: ±20%; Package: 0805; CommentBase: Конденсатор 1 мкФ ±20% 100 В X7R 0805; Dielectric: X7R; ComponentLink2URL: https://yageogroup.com/content/datasheet/asset/file/UPY-GPHC_X7R_6_3V-TO-250V; ComponentLink2Description: Даташит — производитель; HelpURL: C:\Users\Nomatin\Documents\Altium\MY_LIB\MY_LIB\Datasheets\YAGEO_CC_X7R.pdf; ComponentLink1URL: C:\Users\Nomatin\Documents\Altium\MY_LIB\MY_LIB\Datasheets\YAGEO_CC_X7R.pdf; ComponentLink1Description: Даташит — локальный; Datasheet: C:\Users\Nomatin\Documents\Altium\MY_LIB\MY_LIB\Datasheets\YAGEO_CC_X7R.pdf
C8 C11 = C0219: Конденсатор 10 нФ ±10% 100 В X7R 0603; Manufacturer: YAGEO; MPN: CC0603KRX7R0BB103; ID: C0219; Value: 10n; Voltage: 100 В; Notes: YAGEO CC; список 20.10.2026; CapacitanceNominalF: 1E-8; DissipationFactorMax: 0.025; DFTestFrequencyHz: 1000; DFTestVoltageVrms: 1; DFTestTemperatureC: 20; InsulationTimeConstantMinS: 500; InsulationResistanceMinOhm: 10000000000; InsulationTestVoltageV: 100; InsulationTestDurationS: 60; EquivalentSeriesResistanceOhm: 397.887357729738; Type: Конденсатор; ESKD_value: 10 нФ; Tolerance: ±10%; Package: 0603; CommentBase: Конденсатор 10 нФ ±10% 100 В X7R 0603; Dielectric: X7R; ComponentLink2URL: https://yageogroup.com/content/datasheet/asset/file/UPY-GPHC_X7R_6_3V-TO-250V; ComponentLink2Description: Даташит — производитель; HelpURL: C:\Users\Nomatin\Documents\Altium\MY_LIB\MY_LIB\Datasheets\YAGEO_CC_X7R.pdf; ComponentLink1URL: C:\Users\Nomatin\Documents\Altium\MY_LIB\MY_LIB\Datasheets\YAGEO_CC_X7R.pdf; ComponentLink1Description: Даташит — локальный; Datasheet: C:\Users\Nomatin\Documents\Altium\MY_LIB\MY_LIB\Datasheets\YAGEO_CC_X7R.pdf
C9 C10 = C0094: Конденсатор 100 нФ ±10% 100 В X7R 0805; Manufacturer: YAGEO; MPN: CC0805KKX7R0BB104; ID: C0094; Value: 100n; Voltage: 100 В; Notes: YAGEO CC; список 20.10.2026; CapacitanceNominalF: 1E-7; DissipationFactorMax: 0.025; DFTestFrequencyHz: 1000; DFTestVoltageVrms: 1; DFTestTemperatureC: 20; InsulationTimeConstantMinS: 500; InsulationResistanceMinOhm: 5000000000; InsulationTestVoltageV: 100; InsulationTestDurationS: 60; EquivalentSeriesResistanceOhm: 39.7887357729738; Type: Конденсатор; ESKD_value: 100 нФ; Tolerance: ±10%; Package: 0805; CommentBase: Конденсатор 100 нФ ±10% 100 В X7R 0805; Dielectric: X7R; Datasheet: C:\Users\Nomatin\Documents\Altium\MY_LIB\MY_LIB\Datasheets\YAGEO_CC_X7R.pdf; ComponentLink1Description: Даташит — локальный; ComponentLink1URL: C:\Users\Nomatin\Documents\Altium\MY_LIB\MY_LIB\Datasheets\YAGEO_CC_X7R.pdf; ComponentLink2Description: Даташит — производитель; ComponentLink2URL: https://yageogroup.com/content/datasheet/asset/file/UPY-GPHC_X7R_6_3V-TO-250V; HelpURL: C:\Users\Nomatin\Documents\Altium\MY_LIB\MY_LIB\Datasheets\YAGEO_CC_X7R.pdf
D4 = U0004: Микросхема ISOW1432DFMR; Manufacturer: Texas Instruments; ID: U0004; Voltage: VIO: 1,71–1,89 / 2,25–5,5 В; VDD: 3–5,5 В; Notes: RS-485/RS-422 full duplex, 12 Мбит/с; DC-DC. Внешние соединения GNDIO/GND1, VISOOUT/VISOIN, GISOIN/GND2 — по TI.; TemperatureReference: TA (ambient), °C; recommended operating; JunctionTemperatureMin: -40; JunctionTemperatureMax: 150; Type: Микросхема; Value: ISOW1432DFMR; ESKD_value: ISOW1432DFMR; Package: SOIC-20 DFM (7,5×12,83 мм); MPN: ISOW1432DFMR; CommentBase: Микросхема ISOW1432DFMR; OperatingTemperatureMin: -40; OperatingTemperatureMax: 125; StorageTemperatureMin: -65; StorageTemperatureMax: 150; Datasheet: C:\Users\Nomatin\Documents\Altium\MY_LIB\MY_LIB\Datasheets\ISOW1432_TI.pdf; DatasheetRevision: SLLSF86D, August 2026; ComponentLink1Description: Даташит — локальный; ComponentLink1URL: C:\Users\Nomatin\Documents\Altium\MY_LIB\MY_LIB\Datasheets\ISOW1432_TI.pdf; ComponentLink2Description: Даташит — производитель; ComponentLink2URL: https://www.ti.com/lit/ds/symlink/isow1432.pdf; HelpURL: C:\Users\Nomatin\Documents\Altium\MY_LIB\MY_LIB\Datasheets\ISOW1432_TI.pdf
L1 = L0005: Ферритовый фильтр MPZ2012S601AT000; Manufacturer: TDK; ID: L0005; Tolerance: ±25%; Notes: Неполярный; выводы 1–2. Импеданс при 100 МГц; DCR — начальное максимальное значение. Ток номинальный при температуре компонента до 85 °C; выше — снижение по графику. Температура включает саморазогрев.; ImpedanceOhm: 600; TestFrequencyMHz: 100; RatedCurrentA: 2; DCResistanceMaxOhm: 0.1; TemperatureReference: Component temperature including self-heating, °C; current derating above 85°C; Grade: Commercial; PackagingQuantity: 4000; SimulationModelSource: MY_LIB; S-parameters and sampled TDK Precise outputs; SimulationModelType: Independent passive black-box RLC; SimulationReferenceTemperatureC: 25; SimulationDCBiasCurrentA: 0; SimulationSignalCondition: Small signal; Value: 600 Ом @ 100 МГц; Type: Ферритовый фильтр; ESKD_value: 600 Ом @ 100 МГц; Package: 0805; MPN: MPZ2012S601AT000; CommentBase: Ферритовый фильтр MPZ2012S601AT000; Datasheet: C:\Users\Nomatin\Documents\Altium\MY_LIB\MY_LIB\Datasheets\Ferrite_Beads\TDK_MPZ2012_commercial.pdf; ComponentLink1Description: Даташит — локальный; ComponentLink1URL: C:\Users\Nomatin\Documents\Altium\MY_LIB\MY_LIB\Datasheets\Ferrite_Beads\TDK_MPZ2012_commercial.pdf; ComponentLink2Description: Даташит — производитель; ComponentLink2URL: https://product.tdk.com/en/system/files/dam/doc/product/emc/emc/beads/catalog/beads_commercial_power_mpz2012_en.pdf; HelpURL: C:\Users\Nomatin\Documents\Altium\MY_LIB\MY_LIB\Datasheets\Ferrite_Beads\TDK_MPZ2012_commercial.pdf; OperatingTemperatureMin: -55; OperatingTemperatureMax: 125; Family: MPZ2012S; Packaging: 180 mm paper tape; DatasheetRevision: 2019-04-24
L2 L3 = L0028: Ферритовый фильтр BLM21PG331SN1D; Manufacturer: Murata; ID: L0028; Tolerance: ±25%; Notes: Неполярный; выводы 1–2. Импеданс при 100 МГц; DCR — начальное максимальное значение. Ток указан при TA=85 °C, отдельное поле — при TA=125 °C; выше 85 °C требуется снижение тока. Ширину подводящей меди выбирать по даташиту с учётом тока и толщины меди.; ImpedanceOhm: 330; TestFrequencyMHz: 100; RatedCurrentA: 1.5; RatedCurrent125CA: 1; DCResistanceMaxOhm: 0.07; TemperatureReference: TA, °C; rated current at 85°C / 125°C; Grade: Consumer/industrial; PackagingQuantity: 4000; SimulationModelSource: MY_LIB; sampled Murata SPICE outputs; S-parameter comparison; SimulationModelType: Independent passive black-box RLC; SimulationReferenceTemperatureC: 25; SimulationDCBiasCurrentA: 0; SimulationSignalCondition: Small signal; Value: 330 Ом @ 100 МГц; Type: Ферритовый фильтр; ESKD_value: 330 Ом @ 100 МГц; Package: 0805; MPN: BLM21PG331SN1D; CommentBase: Ферритовый фильтр BLM21PG331SN1D; Datasheet: C:\Users\Nomatin\Documents\Altium\MY_LIB\MY_LIB\Datasheets\Ferrite_Beads\Murata_ENFA0005.pdf; ComponentLink1Description: Даташит — локальный; ComponentLink1URL: C:\Users\Nomatin\Documents\Altium\MY_LIB\MY_LIB\Datasheets\Ferrite_Beads\Murata_ENFA0005.pdf; ComponentLink2Description: Даташит — производитель; ComponentLink2URL: https://www.murata.com/products/productdata/8796738977822/ENFA0005.pdf; HelpURL: C:\Users\Nomatin\Documents\Altium\MY_LIB\MY_LIB\Datasheets\Ferrite_Beads\Murata_ENFA0005.pdf; OperatingTemperatureMin: -55; OperatingTemperatureMax: 125; Family: BLM21PG; Packaging: 180 mm paper tape; DatasheetRevision: JENF243A_0005AE-01
R11 = R0242: Резистор 4,7 кОм ±5% 0805; Manufacturer: YAGEO; MPN: RC0805JR-074K7L; ID: R0242; Value: 4.7k; Power: 0,125 Вт; Voltage: 150 В макс.; Notes: RC_L; E24; P при 70 °C; SPICE: +100 ppm/°C при 25 °C — положительная граница ±100, не измеренный ТКС (RC_L, табл.2/5, стр.5/8).; TCR: ±100 ppm/°C; Type: Резистор; ESKD_value: 4,7 кОм; Tolerance: ±5%; Package: 0805; CommentBase: Резистор 4,7 кОм ±5% 0805; ComponentLink2URL: https://yageogroup.com/content/datasheet/asset/file/PYU-RC_GROUP_51_ROHS_L; ComponentLink2Description: Даташит — производитель; HelpURL: C:\Users\Nomatin\Documents\Altium\MY_LIB\MY_LIB\Datasheets\YAGEO_RC_L.pdf; ComponentLink1URL: C:\Users\Nomatin\Documents\Altium\MY_LIB\MY_LIB\Datasheets\YAGEO_RC_L.pdf; ComponentLink1Description: Даташит — локальный; Datasheet: C:\Users\Nomatin\Documents\Altium\MY_LIB\MY_LIB\Datasheets\YAGEO_RC_L.pdf

## Nets that join several sheets
GND: MAIN (8 pins), USBtoUART (7 pins), UARTtoRS485 (6 pins)
GND_ISO: MAIN (D2.3 XS2.1), UARTtoRS485 (C10.1 C13.1 D4.15 L3.1)
VBUS: MAIN (6 pins), USBtoUART (C2.2 C3.2 D3.7 R8.2), UARTtoRS485 (L1.2)
VIO: MAIN (TP3.1 VD2.2 VD3.2), USBtoUART (5 pins), UARTtoRS485 (C9.2 D4.1 R11.2)
VISO: MAIN (TP8.1), UARTtoRS485 (C10.2 C13.2 D4.16 L2.1)
D_N: MAIN (D1.4), USBtoUART (D3.4)
D_P: MAIN (D1.6), USBtoUART (D3.3)
EN_DC: MAIN (R5.2 TP7.1), UARTtoRS485 (D4.8 R11.1)
RS485: MAIN (TP5.1), USBtoUART (D3.12), UARTtoRS485 (D4.3 D4.5)
RS485_N: MAIN (D2.2 SA1.2 XS2.9), UARTtoRS485 (D4.18 D4.19)
RS485_P: MAIN (D2.1 R7.2 XS2.5), UARTtoRS485 (D4.17 D4.20)
RXD: MAIN (TP6.1), USBtoUART (D3.20), UARTtoRS485 (D4.4)
RXT: MAIN (R4.1), USBtoUART (D3.13)
SYSb: MAIN (R5.1 TP2.1), USBtoUART (D3.15)
TXD: MAIN (TP4.1), USBtoUART (D3.21), UARTtoRS485 (D4.2)
TXT: MAIN (R6.1), USBtoUART (D3.14)